# Altium project PDB_Motherboard_Layout_27.PrjPcb
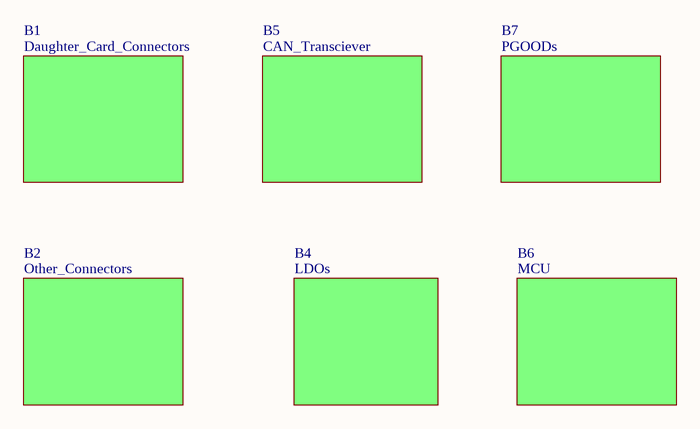
[diagram p0: Motherboard.SchDoc]
7 sheets, 128 parts. Net scope: flat (ports and power ports of the same name join across sheets).
Board file: testPCB.PcbDoc
Sheets:
  Motherboard.SchDoc
    B1 = Daughter_Card_Connectors.SchDoc
    B2 = Other_Connectors.SchDoc
    B4 = LDOs.SchDoc
    B5 = CAN_Transciever.SchDoc
    B6 = MCU.SchDoc
    B7 = PGOODs.SchDoc

## Sheet Motherboard.SchDoc
size A; SheetNumber: 1; SheetTotal: 7

### Sub-sheets
B1 = Daughter_Card_Connectors: no entries
B2 = Other_Connectors: no entries
B4 = LDOs: no entries
B5 = CAN_Transciever: no entries
B6 = MCU: no entries
B7 = PGOODs: no entries

## Sheet Daughter_Card_Connectors.SchDoc
size A; SheetNumber: 7; SheetTotal: 7
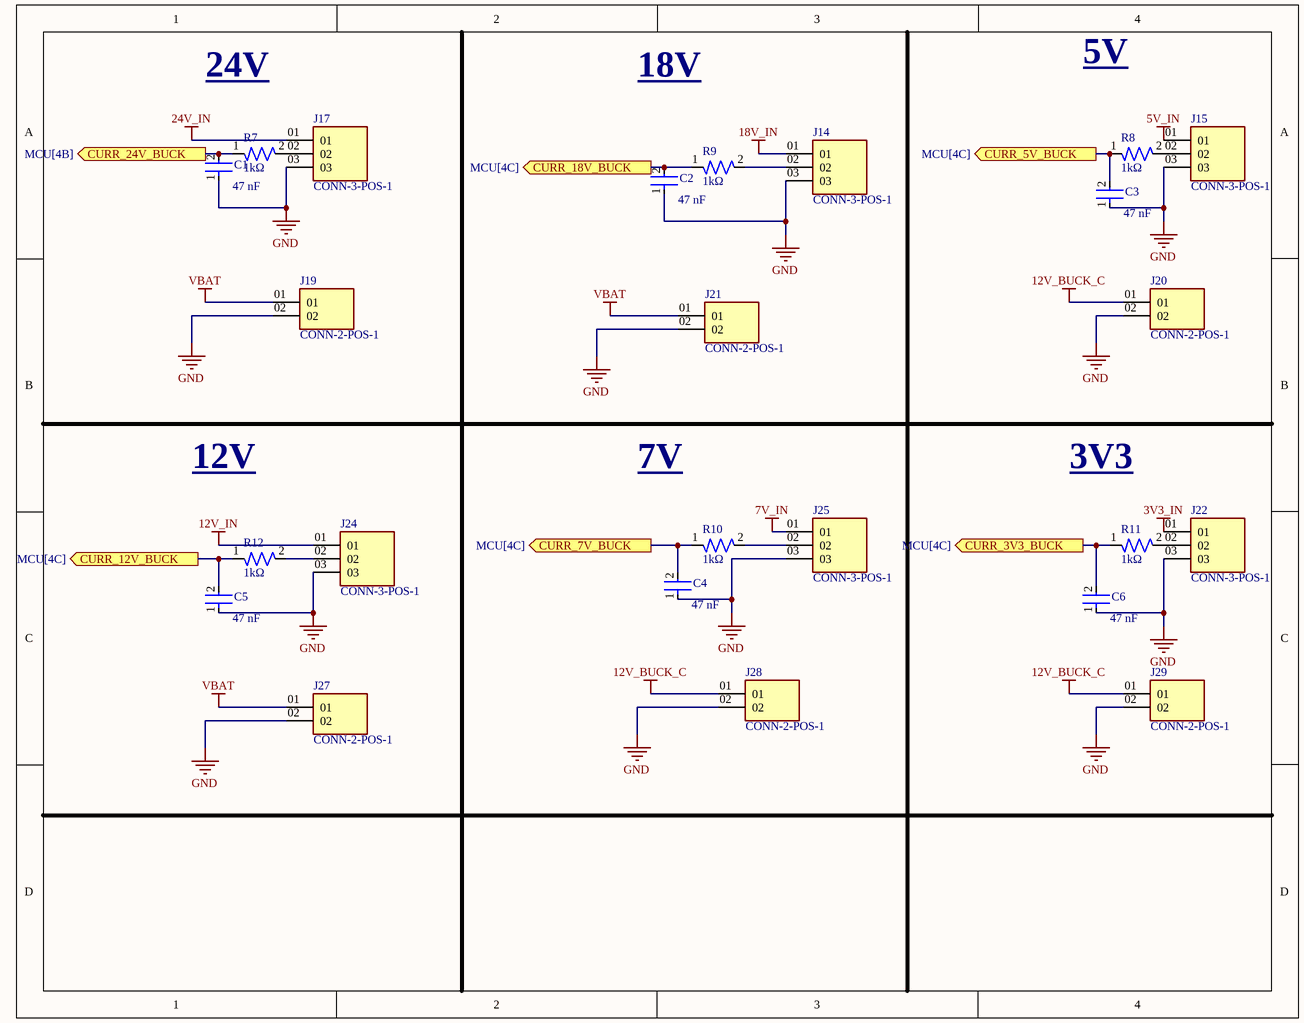
[diagram p1: Daughter_Card_Connectors.SchDoc]

### Parts
C1  Capacitance: 47 nF  [CAP-0603]  (hidden comment: GRM1885C1H302JA01D)
C2  Capacitance: 47 nF  [CAP-0603]  (hidden comment: GRM1885C1H302JA01D)
C3  Capacitance: 47 nF  [CAP-0603]  (hidden comment: GRM1885C1H302JA01D)
C4  Capacitance: 47 nF  [CAP-0603]  (hidden comment: GRM1885C1H302JA01D)
C5  Capacitance: 47 nF  [CAP-0603]  (hidden comment: GRM1885C1H302JA01D)
C6  Capacitance: 47 nF  [CAP-0603]  (hidden comment: GRM1885C1H302JA01D)
J14  CONN-3-POS-1  [SAMTEC_UMPS-03-03.5-L-V-S-W-TR]
J15  CONN-3-POS-1  [SAMTEC_UMPS-03-03.5-L-V-S-W-TR]
J17  CONN-3-POS-1  [SAMTEC_UMPS-03-03.5-L-V-S-W-TR]
J19  CONN-2-POS-1  [SAMTEC_UMPS-02-X-X-V-S-W-X]
J20  CONN-2-POS-1  [SAMTEC_UMPS-02-X-X-V-S-W-X]
J21  CONN-2-POS-1  [SAMTEC_UMPS-02-X-X-V-S-W-X]
J22  CONN-3-POS-1  [SAMTEC_UMPS-03-03.5-L-V-S-W-TR]
J24  CONN-3-POS-1  [SAMTEC_UMPS-03-03.5-L-V-S-W-TR]
J25  CONN-3-POS-1  [SAMTEC_UMPS-03-03.5-L-V-S-W-TR]
J27  CONN-2-POS-1  [SAMTEC_UMPS-02-X-X-V-S-W-X]
J28  CONN-2-POS-1  [SAMTEC_UMPS-02-X-X-V-S-W-X]
J29  CONN-2-POS-1  [SAMTEC_UMPS-02-X-X-V-S-W-X]
R7  Resistance: 1kΩ  [RES-0603]  (hidden comment: CRF2010-J/-000ELF)
R8  Resistance: 1kΩ  [RES-0603]  (hidden comment: CRF2010-J/-000ELF)
R9  Resistance: 1kΩ  [RES-0603]  (hidden comment: CRF2010-J/-000ELF)
R10  Resistance: 1kΩ  [RES-0603]  (hidden comment: CRF2010-J/-000ELF)
R11  Resistance: 1kΩ  [RES-0603]  (hidden comment: CRF2010-J/-000ELF)
R12  Resistance: 1kΩ  [RES-0603]  (hidden comment: CRF2010-J/-000ELF)

### Ports
CURR_3V3_BUCK (out, see MCU[4C]), CURR_5V_BUCK (out, see MCU[4C]), CURR_7V_BUCK (out, see MCU[4C]), CURR_12V_BUCK (out, see MCU[4C]), CURR_18V_BUCK (out, see MCU[4C]), CURR_24V_BUCK (out, see MCU[4B])

### Nets
3V3_IN: J22.01
5V_IN: J15.01
7V_IN: J25.01
12V_BUCK_C: J20.01 J28.01 J29.01
12V_IN: J24.01
18V_IN: J14.01
24V_IN: J17.01
GND: C1.1 C2.1 C3.1 C4.1 C5.1 C6.1 J14.03 J15.03 J17.03 J19.02 J20.02 J21.02 J22.03 J24.03 J25.03 J27.02 J28.02 J29.02  [project net AGND]
VBAT: J19.01 J21.01 J27.01
CURR_3V3_BUCK: C6.2 R11.1 ; port CURR_3V3_BUCK
CURR_5V_BUCK: C3.2 R8.1 ; port CURR_5V_BUCK
CURR_7V_BUCK: C4.2 R10.1 ; port CURR_7V_BUCK
CURR_12V_BUCK: C5.2 R12.1 ; port CURR_12V_BUCK
CURR_18V_BUCK: C2.2 R9.1 ; port CURR_18V_BUCK
CURR_24V_BUCK: C1.2 R7.1 ; port CURR_24V_BUCK
NetJ14_02: J14.02 R9.2
NetJ15_02: J15.02 R8.2
NetJ17_02: J17.02 R7.2
NetJ22_02: J22.02 R11.2
NetJ24_02: J24.02 R12.2
NetJ25_02: J25.02 R10.2

### Notes on the sheet
- 24V
- 18V
- 5V
- 12V
- 7V
- 3V3

### Library data of the parts
C1-C6 = CAP-3N-0001: 3000 pF ±5% 50V Ceramic Capacitor C0G, NP0 0603 (1608 Metric); Device Class: Ceramic; Size: 1210; ComponentLink1Description: Datasheet; ComponentLink1URL: https://mm.digikey.com/Volume0/opasdata/d220001/medias/docus/41/CL32B106KBJNNNE_Spec.pdf; Voltage: 50V
J14 J15 J17 J22 J24 J25 = CONN-3-POS-1: 3 Position Receptacle, Female Blade Sockets Connector Solder 0.079 (2.00mm) Surface Mount; MF: Samtec Inc.; MP: UMPS-03-03.5-L-V-S-W-TR; SnapEDA_Link: https://www.snapeda.com/parts/UMPS-03-03.5-L-V-S-W-TR/Samtec/view-part/?ref=snap; Package: None; Value: *; Check_prices: https://www.snapeda.com/parts/UMPS-03-03.5-L-V-S-W-TR/Samtec/view-part/?ref=eda
J19-J21 J27-J29 = CONN-2-POS-1: MF: SAMTEC; MP: UMPS-02-X-X-V-S-W-X; Package: None; Price: None; Value: *; Availability: Unavailable
R7-R12 = RES-0-0001: 0 Ohms Jumper Chip Resistor 2010 (5025 Metric) Automotive AEC-Q200 Metal Element; Tolerance: 1%; Size: 0603; ComponentLink1Description: Datasheet; ComponentLink1URL: https://www.yageo.com/upload/media/product/products/datasheet/rchip/PYu-RC_Group_51_RoHS_L_12.pdf

## Sheet Other_Connectors.SchDoc
size A; SheetNumber: 6; SheetTotal: 7
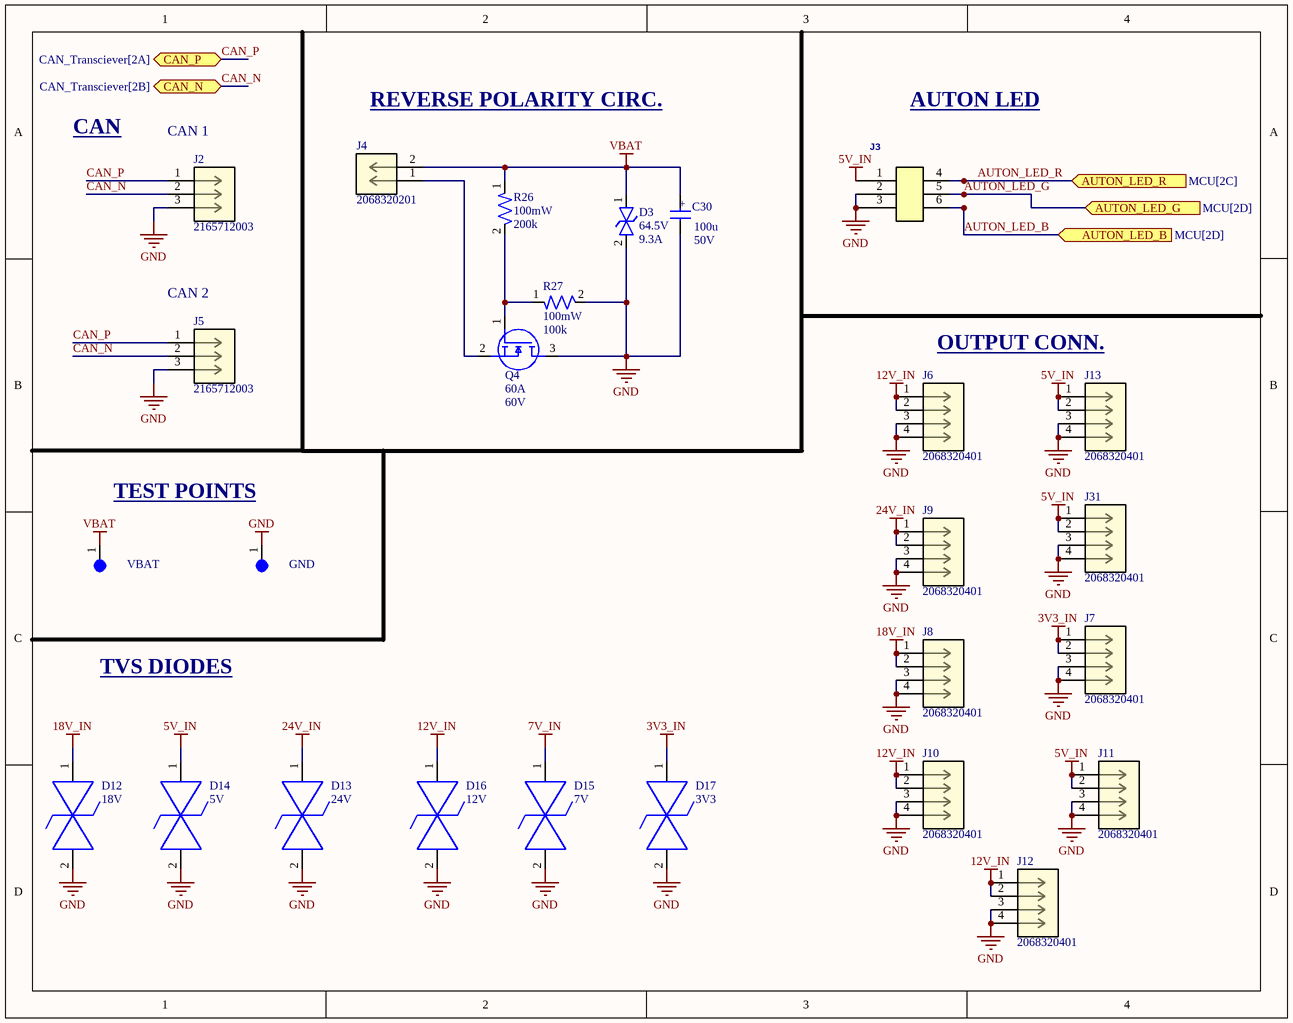
[diagram p2: Other_Connectors.SchDoc]

### Parts
C30  Capacitance: 100u  Voltage: 50V  [WCAP-ATUL_8X11.5(DXL)]  (hidden comment: 860040674004)
D3  Voltage Rating: 64.5V  Current Rating: 9.3A  [DO-214AA (SMBJ)]  (hidden comment: SMBJ40CA)
D12  Clamping Voltage: 18V  [DO-214AA (SMBJ)]  (hidden comment: SMBJ18)
D13  Voltage: 24V  [DO-214AA (SMBJ)]  (hidden comment: SMBJ5.0)
D14  Voltage: 5V  [DO-214AA (SMBJ)]  (hidden comment: SMBJ5.0)
D15  Voltage: 7V  [DO-214AA (SMBJ)]  (hidden comment: SMBJ12)
D16  Voltage: 12V  [DO-214AA (SMBJ)]  (hidden comment: SMBJ12)
D17  Voltage: 3V3  [DO-214AA (SMBJ)]  (hidden comment: SMBJ12)
GND  5003  [TEST-POINT-0001]  (value not drawn)
J2  2165712003  [CONN_2165710003-SD_03_MOL]
J3  Molex 43045-0612  [CONN_2068320000-SD_06_MOL]  (value not drawn)
J4  2068320201  [CONN_2068320000-SD_02_MOL]
J5  2165712003  [CONN_2165710003-SD_03_MOL]
J6  2068320401  [CONN_2068320000-SD_04_MOL]
J7  2068320401  [CONN_2068320000-SD_04_MOL]
J8  2068320401  [CONN_2068320000-SD_04_MOL]
J9  2068320401  [CONN_2068320000-SD_04_MOL]
J10  2068320401  [CONN_2068320000-SD_04_MOL]
J11  2068320401  [CONN_2068320000-SD_04_MOL]
J12  2068320401  [CONN_2068320000-SD_04_MOL]
J13  2068320401  [CONN_2068320000-SD_04_MOL]
J31  2068320401  [CONN_2068320000-SD_04_MOL]
Q4  Voltage: 60V  Continuous Current: 60A  [IC-8VSONCLIP]  (hidden comment: CSD18543Q3AT)
R26  Power: 100mW  Resistance: 200k  [RES-0603]  (hidden comment: RC0603FR-07200KL)
R27  Power: 100mW  Resistance: 100k  [RES-0603]  (hidden comment: RC0603FR-07100KL)
VBAT  5003  [TEST-POINT-0001]  (value not drawn)

### Ports
AUTON_LED_B (in, see MCU[2D]), AUTON_LED_G (in, see MCU[2D]), AUTON_LED_R (in, see MCU[2C]), CAN_N (bidir, see CAN_Transciever[2B]), CAN_P (bidir, see CAN_Transciever[2A])

### Nets
3V3_IN: D17.1 J7.1 J7.2
5V_IN: D14.1 J3.1 J11.1 J11.2 J13.1 J13.2 J31.1 J31.2
7V_IN: D15.1
12V_IN: D16.1 J6.1 J6.2 J10.1 J10.2 J12.1 J12.2
18V_IN: D12.1 J8.1 J8.2
24V_IN: D13.1 J9.1 J9.2
GND: C30.2(NEG) D3.2 D12.2 D13.2 D14.2 D15.2 D16.2 D17.2 GND.1 J2.3 J3.2 J3.3 J5.3 J6.3 J6.4 J7.3 J7.4 J8.3 J8.4 J9.3 J9.4 J10.3 J10.4 J11.3 J11.4 J12.3 J12.4 J13.3 J13.4 J31.3 J31.4 Q4.3(D) R27.2  [project net AGND]
VBAT: C30.1(POS) D3.1 J4.2 R26.1 VBAT.1
AUTON_LED_B: J3.6 ; port AUTON_LED_B
AUTON_LED_G: J3.5 ; port AUTON_LED_G
AUTON_LED_R: J3.4 ; port AUTON_LED_R
CAN_N: J2.2 J5.2 ; port CAN_N
CAN_P: J2.1 J5.1 ; port CAN_P
NetJ4_1: J4.1 Q4.2(S)
NetQ4_1: Q4.1(G) R26.2 R27.1

### Notes on the sheet
- CAN
- (near J2) CAN 1
- REVERSE POLARITY CIRC.
- AUTON LED
- (near J5) CAN 2
- OUTPUT CONN.
- TEST POINTS
- TVS DIODES
- (in symbol CAP-100U-0002) +

### Library data of the parts
C30 = CAP-100U-0002: 100 µF 50 V Aluminum Electrolytic Capacitors Radial, Can 7000 Hrs @ 105°C
D3 = DIO-TVS-0001: TVS DIODE 40VWM 64.5VC DO214AA; ComponentLink1Description: Datasheet; ComponentLink1URL: https://www.littelfuse.com/media?resourcetype=datasheets&itemid=09a6ae9a-73cb-4ac4-acac-e6dab92ab953&filename=littelfuse_tvs_diode_smbj_datasheet.pdf
D12 = DIODE-18V-0001: 30.66V Clamp 20.6A Ipp Tvs Diode Surface Mount DO-214AA (SMBJ); Manufacturer_Name: Littelfuse Inc; Copyright: Copyright (C) 2025 Ultra Librarian. All rights reserved.; Manufacturer_Part_Number: SMBJ18
D13 D14 = DIO-TVS-5V: 9.66V Clamp 65.3A Ipp Tvs Diode Surface Mount DO-214AA (SMBJ)
D15-D17 = DIO-TVS-12V: 20.9V Clamp 30.2A Ipp Tvs Diode Surface Mount DO-214AA (SMBJ)
GND VBAT = TEST-POINT-0001: Oranange PC Test Point, Miniature Phoisphor Bronze Silver Plating Through Hole Mounting Type
J2 J5 = CONN-3-POS-2: Micro-Fit+ Vertical Header, Through Hole, 3.00mm Pitch, Single Row, 3 Circuits, 0.38Âµm Gold (Au) Plating, Glow-Wire Capable, Black; Manufacturer_Name: Molex Connector Corporation; Copyright: Copyright (C) 2026 Ultra Librarian. All rights reserved.; Manufacturer_Part_Number: 2165712003; RefDes: RefDes; Type: Type
J3 = CONN-6POS-0001: CONN HEADER VERT 6POS 3MM; ComponentLink1Description: Datasheet; ComponentLink1URL: https://tools.molex.com/pdm_docs/ps/PS-43045.pdf
J4 = CONN-2-POS-2: Micro-Fit+ Vertical Header, Through Hole, 3.00mm Pitch, Dual Row, 2 Circuits, Tin (Sn) Plating, Glow-Wire Capable, Black, Tray; Manufacturer_Name: Molex Connector Corporation; Copyright: Copyright (C) 2025 Ultra Librarian. All rights reserved.; Manufacturer_Part_Number: 2068320201; RefDes: RefDes; Type: Type
J6-J13 J31 = CONN-4-POS-1: Micro-Fit+ Vertical Header, Through Hole, 3.00mm Pitch, Dual Row, 4 Circuits, Tin (Sn) Plating, Glow-Wire Capable, Black, Tray; Manufacturer_Name: Molex Connector Corporation; Copyright: Copyright (C) 2025 Ultra Librarian. All rights reserved.; Manufacturer_Part_Number: 2068320401; RefDes: RefDes; Type: Type
Q4 = NMOS-60A-0001: MOSFET N-CH 60V 12A/60A 8VSON; ComponentLink2Description: Datasheet; ComponentLink2URL: http://www.ti.com/lit/ds/symlink/csd18543q3a.pdf
R26 = RES-200k-0001: RES SMD 200K OHM 1% 1/10W 0603; Tolerance: 1%; Size: 0603; ComponentLink1Description: Datasheet; ComponentLink1URL: https://www.yageo.com/upload/media/product/products/datasheet/rchip/PYu-RC_Group_51_RoHS_L_12.pdf
R27 = RES-100k-0001: RES SMD 100K OHM 1% 1/10W 0603; Tolerance: 1%; Size: 0603; ComponentLink1Description: Datasheet; ComponentLink1URL: https://www.yageo.com/upload/media/product/products/datasheet/rchip/PYu-RC_Group_51_RoHS_L_12.pdf

## Sheet LDOs.SchDoc
size A; SheetNumber: 5; SheetTotal: 7
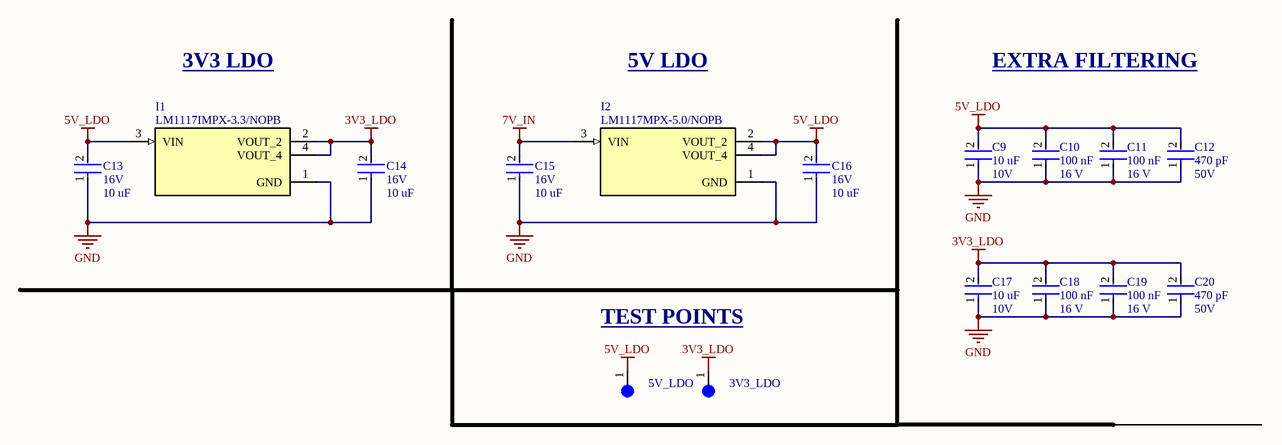
[diagram p3: LDOs.SchDoc]

### Parts
3V3_LDO  5003  [TEST-POINT-0001]  (value not drawn)
5V_LDO  5003  [TEST-POINT-0001]  (value not drawn)
C9  Voltage: 10V  Capacitance: 10 uF  [CAP-0603]  (hidden comment: CC0603KRX5R6BB106)
C10  Voltage Rating: 16 V  Capacitance: 100 nF  [CAP-0603]  (hidden comment: CC0402KRX7R7BB104)
C11  Voltage Rating: 16 V  Capacitance: 100 nF  [CAP-0603]  (hidden comment: CC0402KRX7R7BB104)
C12  Voltage: 50V  Capacitance: 470 pF  [CAP-0805]  (hidden comment: CC0805JRNPO9BN471)
C13  Voltage: 16V  Capacitance: 10 uF  [CAP-1206]  (hidden comment: 293D106X9016A2TE3)
C14  Voltage: 16V  Capacitance: 10 uF  [CAP-1206]  (hidden comment: 293D106X9016A2TE3)
C15  Voltage: 16V  Capacitance: 10 uF  [CAP-1206]  (hidden comment: 293D106X9016A2TE3)
C16  Voltage: 16V  Capacitance: 10 uF  [CAP-1206]  (hidden comment: 293D106X9016A2TE3)
C17  Voltage: 10V  Capacitance: 10 uF  [CAP-0603]  (hidden comment: CC0603KRX5R6BB106)
C18  Voltage Rating: 16 V  Capacitance: 100 nF  [CAP-0603]  (hidden comment: CC0402KRX7R7BB104)
C19  Voltage Rating: 16 V  Capacitance: 100 nF  [CAP-0603]  (hidden comment: CC0402KRX7R7BB104)
C20  Voltage: 50V  Capacitance: 470 pF  [CAP-0805]  (hidden comment: CC0805JRNPO9BN471)
I1  LM1117IMPX-3.3/NOPB  [IC-SOT-223-4]
I2  LM1117MPX-5.0/NOPB  [IC-SOT-223-4]

### Nets
3V3_LDO: 3V3_LDO.1 C14.2 C17.2 C18.2 C19.2 C20.2 I1.2(VOUT_2) I1.4(VOUT_4)  [project net VBAT_MCU]
5V_LDO: 5V_LDO.1 C9.2 C10.2 C11.2 C12.2 C13.2 C16.2 I1.3(VIN) I2.2(VOUT_2) I2.4(VOUT_4)
7V_IN: C15.2 I2.3(VIN)
GND: C9.1 C10.1 C11.1 C12.1 C13.1 C14.1 C15.1 C16.1 C17.1 C18.1 C19.1 C20.1 I1.1(GND) I2.1(GND)  [project net AGND]

### Notes on the sheet
- 3V3 LDO
- 5V LDO
- EXTRA FILTERING
- TEST POINTS

### Library data of the parts
3V3_LDO 5V_LDO = TEST-POINT-0001: as GND on sheet Other_Connectors
C9 C17 = CAP-10U-0001: CAP CER 10UF 10V X5R 0603; ComponentLink1Description: Datasheet; ComponentLink1URL: https://www.yageo.com/upload/media/product/app/datasheet/mlcc/upy-gphc_x5r_4v-to-50v.pdf; Device Class: Ceramic; Size: 0603
C10 C11 C18 C19 = CAP-0.1U-0001: CAP CER 0.1UF 16V X7R 0402; ComponentLink2Description: Datasheet; ComponentLink2URL: https://www.yageo.com/upload/media/product/productsearch/datasheet/mlcc/UPY-GPHC_X7R_6.3V-to-250V_24.pdf; Device Class: Ceramic; Size: 0402
C12 C20 = CAP-470P-0001: CAP CER 470PF 50V C0G/NPO 0805; Device Class: Ceramic; Size: 0805; ComponentLink1Description: Datasheet; ComponentLink1URL: https://www.yageo.com/upload/media/product/productsearch/datasheet/mlcc/UPY-GP_NP0_16V-to-50V_18.pdf
C13-C16 = CAP-10U-0004: CAP TANT 10UF 10% 16V 1206; Device Class: Tantalum; Size: 1206; ComponentLink1Description: Datasheet; ComponentLink1URL: https://www.lcsc.com/datasheet/lcsc_datasheet_2304140030_Vishay-Intertech-293D106X9016A2TE3_C110038.pdf
I1 = IC_LDO_3V3_0001: IC REG LIN 3.3V 800MA SOT223-4; ComponentLink1Description: New link; ComponentLink1URL: https://www.ti.com/lit/ds/symlink/lm1117.pdf?HQS=dis-dk-null-digikeymode-dsf-pf-null-wwe&ts=1721700739746
I2 = IC_LDO_5V_0001: IC REG LINEAR 5V 800MA SOT223-4; ComponentLink1Description: Datasheet; ComponentLink1URL: https://www.ti.com/lit/ds/symlink/lm1117.pdf?HQS=dis-dk-null-digikeymode-dsf-pf-null-wwe&ts=1721700739746

## Sheet CAN_Transciever.SchDoc
size A; SheetNumber: 2; SheetTotal: 7
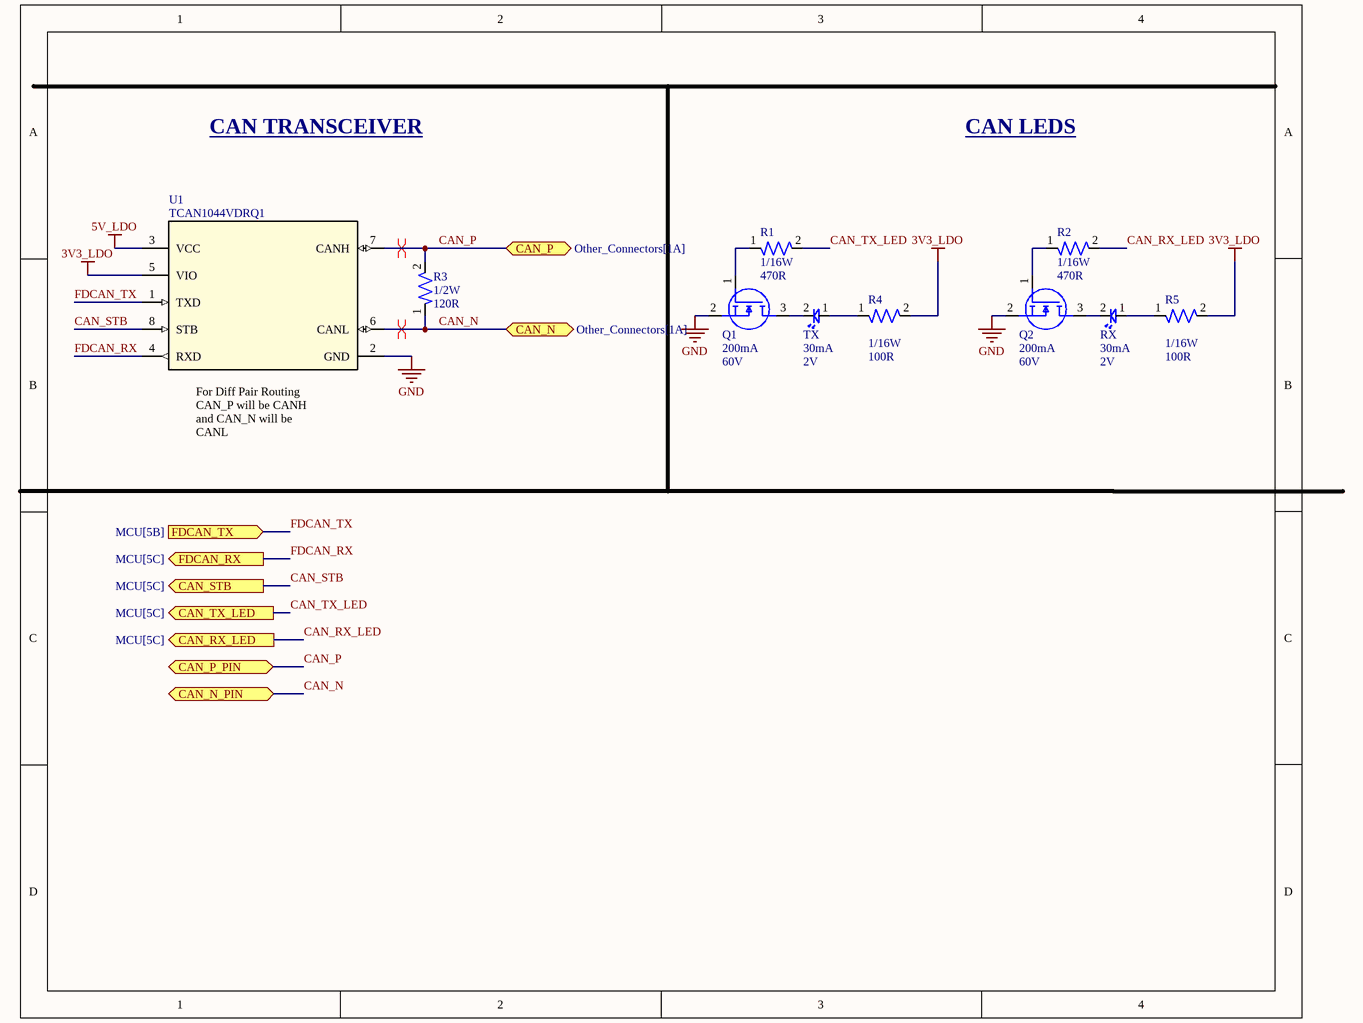
[diagram p4: CAN_Transciever.SchDoc]

### Parts
Q1  Continuous Current: 200mA  Voltage: 60V  [IC-SOT23-3]  (hidden comment: T2N7002AK,LM)
Q2  Continuous Current: 200mA  Voltage: 60V  [IC-SOT23-3]  (hidden comment: T2N7002AK,LM)
R1  Power: 1/16W  Resistance: 470R  [RES-0603]  (hidden comment: RC0402FR-07470RL)
R2  Power: 1/16W  Resistance: 470R  [RES-0603]  (hidden comment: RC0402FR-07470RL)
R3  Power: 1/2W  Resistance: 120R  [RES-1210]  (hidden comment: RC1210FR-07120RL)
R4  Power: 1/16W  Resistance: 100R  [RES-0603]  (hidden comment: RC0603FR-07100RL)
R5  Power: 1/16W  Resistance: 100R  [RES-0603]  (hidden comment: RC0603FR-07100RL)
RX  Forward Current: 30mA  Forward Voltage: 2V  [LED-0603]  (hidden comment: BL-HKC36G-AV-TRB)
TX  Forward Current: 30mA  Forward Voltage: 2V  [LED-0603]  (hidden comment: BL-HKC36G-AV-TRB)
U1  TCAN1044VDRQ1  [IC-8SOIC]

### Ports
CAN_N (bidir, see Other_Connectors[1A]), CAN_N_PIN (bidir), CAN_P (bidir, see Other_Connectors[1A]), CAN_P_PIN (bidir), CAN_RX_LED (out, see MCU[5C]), CAN_STB (out, see MCU[5C]), CAN_TX_LED (out, see MCU[5C]), FDCAN_RX (out, see MCU[5C]), FDCAN_TX (in, see MCU[5B])

### Nets
3V3_LDO: R4.2 R5.2 U1.5(VIO)  [project net VBAT_MCU]
5V_LDO: U1.3(VCC)
GND: Q1.2(S) Q2.2(S) U1.2(GND)  [project net AGND]
CAN_N: R3.1 U1.6(CANL) ; port CAN_N_PIN, port CAN_N
CAN_P: R3.2 U1.7(CANH) ; port CAN_P_PIN, port CAN_P
CAN_RX_LED: R2.2 ; port CAN_RX_LED
CAN_STB: U1.8(STB) ; port CAN_STB
CAN_TX_LED: R1.2 ; port CAN_TX_LED
FDCAN_RX: U1.4(RXD) ; port FDCAN_RX
FDCAN_TX: U1.1(TXD) ; port FDCAN_TX
NetQ1_1: Q1.1(G) R1.1
NetQ1_3: Q1.3(D) TX.2
NetQ2_1: Q2.1(G) R2.1
NetQ2_3: Q2.3(D) RX.2
NetR4_1: R4.1 TX.1
NetR5_1: R5.1 RX.1

### Layout directives
differential pair: CAN_N, CAN_P

### Notes on the sheet
- CAN TRANSCEIVER
- CAN LEDS
- (near U1) For Diff Pair Routing CAN_P will be CANH and CAN_N will be CANL

### Library data of the parts
Q1 Q2 = NMOS-200MA-0001: MOSFET N-CH 60V 200MA SOT23; ComponentLink1Description: Datasheet; ComponentLink1URL: https://toshiba.semicon-storage.com/info/T2N7002AK_datasheet_en_20150401.pdf?did=29712&prodName=T2N7002AK
R1 R2 = RES-470-0001: RES 470 OHM 1% 1/16W 0603; Tolerance: 1%; ComponentLink1Description: Datasheet; ComponentLink1URL: https://www.yageo.com/upload/media/product/products/datasheet/rchip/PYu-RC_Group_51_RoHS_L_12.pdf; Size: 0603
R3 = RES-120-0001: RES 120 OHM 1% 1/2W 1210; Tolerance: 1%; Size: 1210; ComponentLink1Description: Datasheet; ComponentLink1URL: https://www.yageo.com/upload/media/product/products/datasheet/rchip/PYu-RC_Group_51_RoHS_L_12.pdf
R4 R5 = RES-100-0001: RES 100 OHM 1% 1/16W 0603; Tolerance: 1%; ComponentLink1Description: Datasheet; ComponentLink1URL: https://www.yageo.com/upload/media/product/products/datasheet/rchip/PYu-RC_Group_51_RoHS_L_12.pdf; Size: 0603
RX TX = LED-0001: LED YELLOW CLEAR 0603 SMD; ComponentLink1Description: Datasheet; ComponentLink1URL: https://www.americanbrightled.com/pdffiles/led-components/smt/BL-HKC36G-AV-TRB.pdf
U1 = IC-CAN-0001: IC TRANSCEIVER 1/1 8SOIC; ComponentLink1Description: Datasheet; ComponentLink1URL: https://www.ti.com/lit/ds/symlink/tcan1044-q1.pdf?HQS=dis-dk-null-digikeymode-dsf-pf-null-wwe&ts=1728758303289&ref_url=https%253A%252F%252Fwww.ti.com%252Fgeneral%252Fdocs%252Fsuppproductinfo.tsp%253FdistId%253D10%2526gotoUrl%253Dhttps%253A%252F%252Fwww.ti.com%252Flit%252Fgpn%252Ftcan1044-q1

## Sheet MCU.SchDoc
size 381 x 241 mm; SheetNumber: 3; SheetTotal: 7
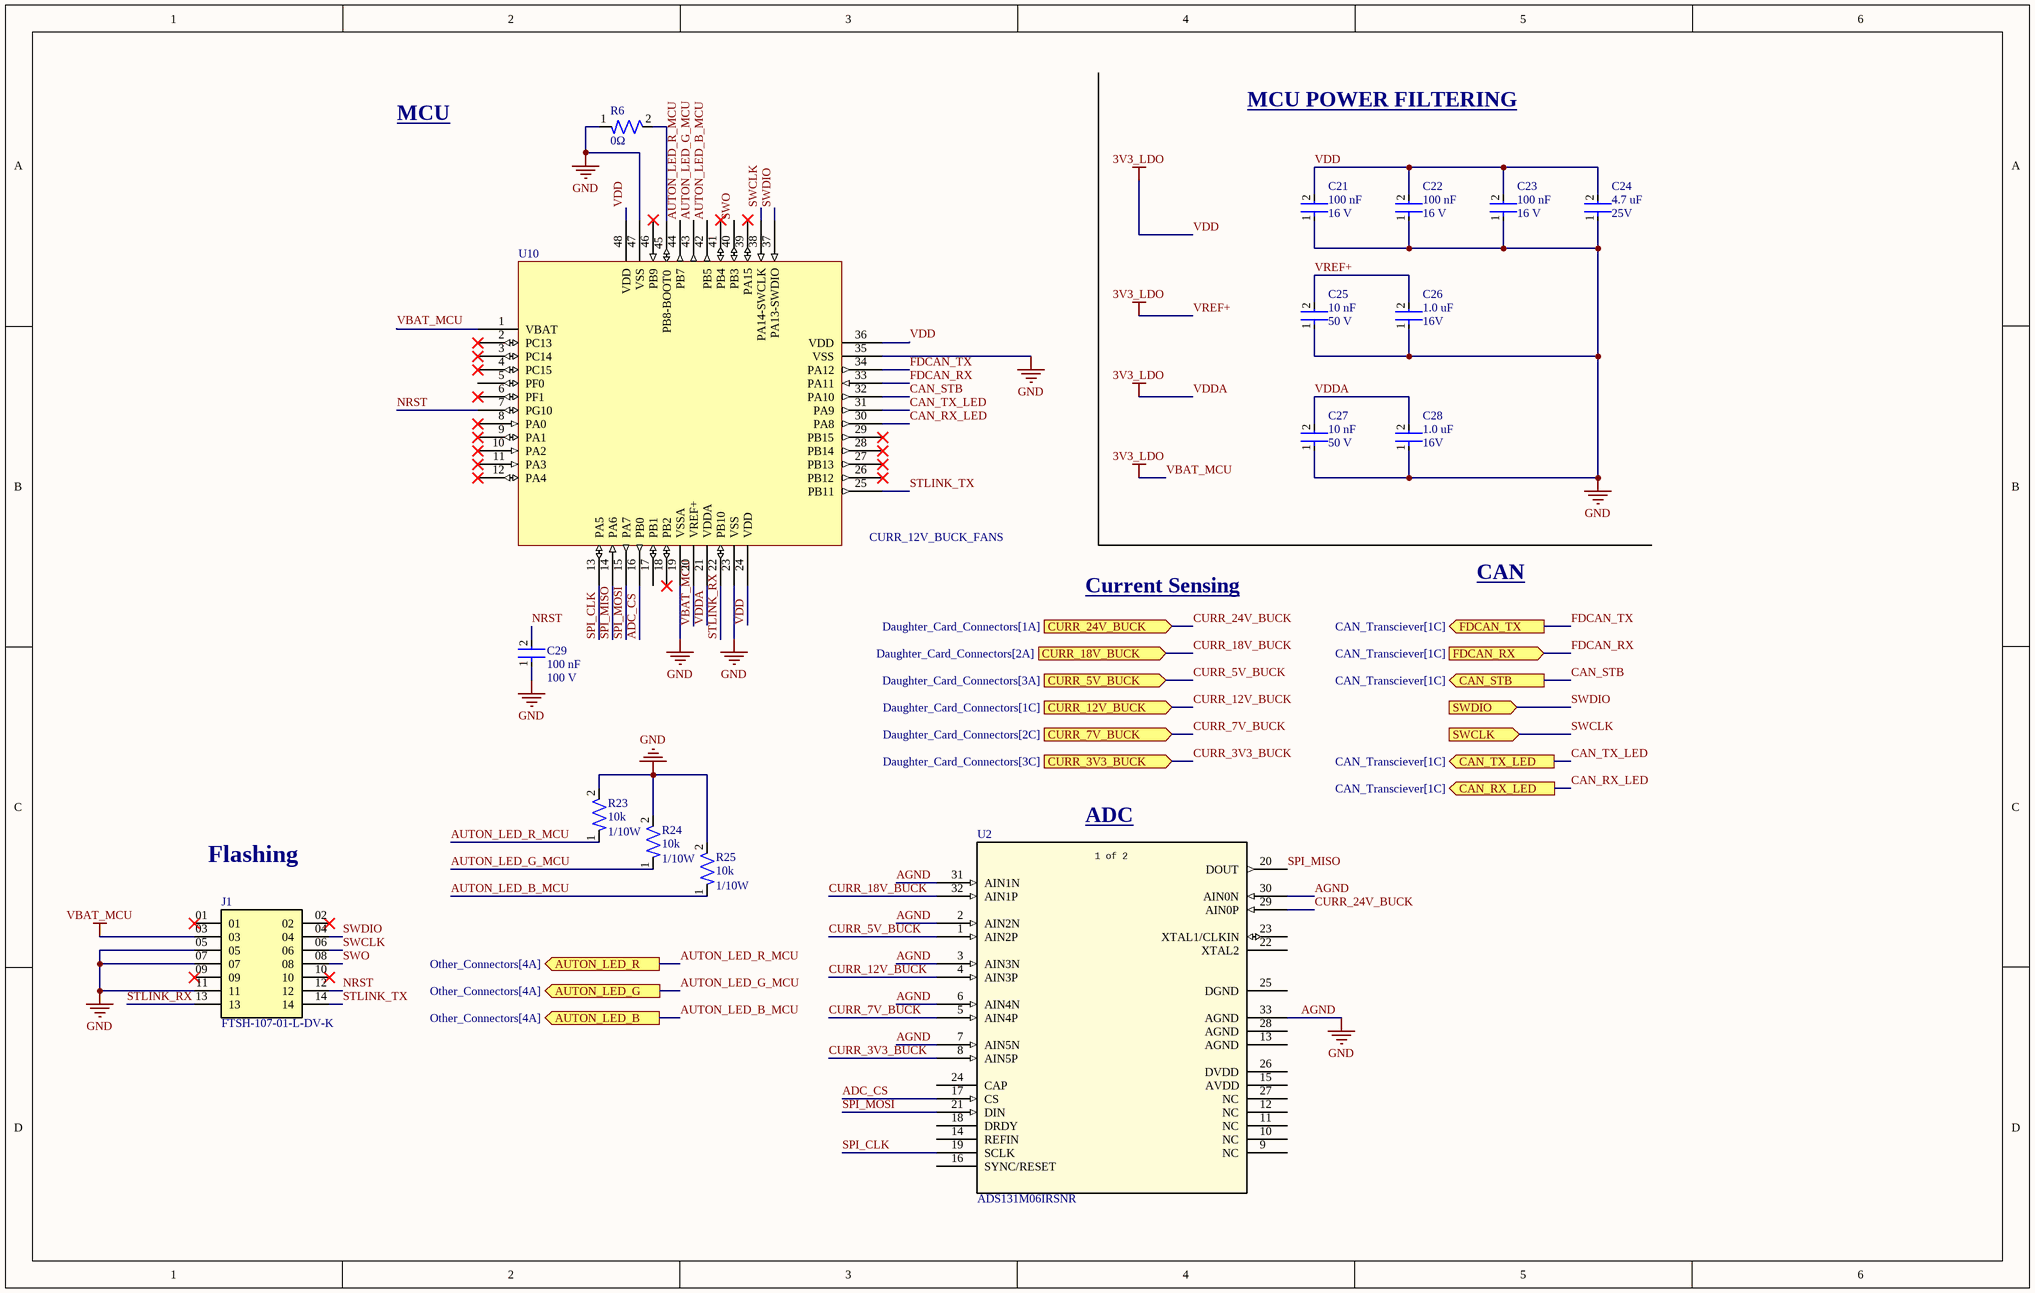
[diagram p5: MCU.SchDoc]

### Parts
C21  Capacitance: 100 nF  Voltage Rating: 16 V  [CAP-0603]  (hidden comment: CC0603KRX7R7BB104)
C22  Capacitance: 100 nF  Voltage Rating: 16 V  [CAP-0603]  (hidden comment: CC0603KRX7R7BB104)
C23  Capacitance: 100 nF  Voltage Rating: 16 V  [CAP-0603]  (hidden comment: CC0603KRX7R7BB104)
C24  Capacitance: 4.7 uF  Voltage: 25V  [CAP-0603]  (hidden comment: CC0603KRX5R8BB475)
C25  Voltage: 50 V  Capacitance: 10 nF  [CAP-0603]  (hidden comment: CC0603KPX7R9BB103)
C26  Capacitance: 1.0 uF  Voltage: 16V  [CAP-0603]  (hidden comment: CC0603KRX7R7BB105)
C27  Voltage: 50 V  Capacitance: 10 nF  [CAP-0603]  (hidden comment: CC0603KPX7R9BB103)
C28  Capacitance: 1.0 uF  Voltage: 16V  [CAP-0603]  (hidden comment: CC0603KRX7R7BB105)
C29  Capacitance: 100 nF  Voltage: 100 V  [CAP-0603]  (hidden comment: CC0603KRX7R0BB104)
J1  FTSH-107-01-L-DV-K  [SAMTEC_FTSH-107-01-L-DV-K]
R6  Resistance: 0Ω  [RES-0603]  (hidden comment: CRF2010-J/-000ELF)
R23  Resistance: 10k  Power: 1/10W  [RES-0603]  (hidden comment: RC0603JR-0710KL)
R24  Resistance: 10k  Power: 1/10W  [RES-0603]  (hidden comment: RC0603JR-0710KL)
R25  Resistance: 10k  Power: 1/10W  [RES-0603]  (hidden comment: RC0603JR-0710KL)
U2  ADS131M06IRSNR  [QFN_M06IRSNR_TEX]
U10  STM32G431CBT6  [IC-LQFP48]  (value not drawn)

### Ports
AUTON_LED_B (out, see Other_Connectors[4A]), AUTON_LED_G (out, see Other_Connectors[4A]), AUTON_LED_R (out, see Other_Connectors[4A]), CAN_RX_LED (out, see CAN_Transciever[1C]), CAN_STB (out, see CAN_Transciever[1C]), CAN_TX_LED (out, see CAN_Transciever[1C]), CURR_3V3_BUCK (in, see Daughter_Card_Connectors[3C]), CURR_5V_BUCK (in, see Daughter_Card_Connectors[3A]), CURR_7V_BUCK (in, see Daughter_Card_Connectors[2C]), CURR_12V_BUCK (in, see Daughter_Card_Connectors[1C]), CURR_18V_BUCK (in, see Daughter_Card_Connectors[2A]), CURR_24V_BUCK (in, see Daughter_Card_Connectors[1A]), FDCAN_RX (in, see CAN_Transciever[1C]), FDCAN_TX (out, see CAN_Transciever[1C]), SWCLK (in), SWDIO (in)

### Nets
AGND: C21.1 C22.1 C23.1 C24.1 C25.1 C26.1 C27.1 C28.1 C29.1 J1.05 J1.07 J1.11 R6.1 R23.2 R24.2 R25.2 U2.2(AIN2N) U2.3(AIN3N) U2.6(AIN4N) U2.7(AIN5N) U2.30(AIN0N) U2.31(AIN1N) U2.33(AGND) U10.19(VSSA) U10.23(VSS) U10.35(VSS) U10.47(VSS)  [also labelled GND]
VBAT_MCU: C21.2 C22.2 C23.2 C24.2 C25.2 C26.2 C27.2 C28.2 J1.03 U10.1(VBAT) U10.20(VREF+) U10.21(VDDA) U10.24(VDD) U10.36(VDD) U10.48(VDD)  [also labelled 3V3_LDO, VDD, VDDA, VREF+]
ADC_CS: U2.17(CS) U10.16(PB0)
AUTON_LED_B_MCU: R25.1 U10.42(PB5) ; port AUTON_LED_B  [project net AUTON_LED_B]
AUTON_LED_G_MCU: R24.1 U10.43(PB6) ; port AUTON_LED_G  [project net AUTON_LED_G]
AUTON_LED_R_MCU: R23.1 U10.44(PB7) ; port AUTON_LED_R  [project net AUTON_LED_R]
CAN_RX_LED: U10.30(PA8) ; port CAN_RX_LED
CAN_STB: U10.32(PA10) ; port CAN_STB
CAN_TX_LED: U10.31(PA9) ; port CAN_TX_LED
CURR_3V3_BUCK: U2.8(AIN5P) ; port CURR_3V3_BUCK
CURR_5V_BUCK: U2.1(AIN2P) ; port CURR_5V_BUCK
CURR_7V_BUCK: U2.5(AIN4P) ; port CURR_7V_BUCK
CURR_12V_BUCK: U2.4(AIN3P) ; port CURR_12V_BUCK
CURR_18V_BUCK: U2.32(AIN1P) ; port CURR_18V_BUCK
CURR_24V_BUCK: U2.29(AIN0P) ; port CURR_24V_BUCK
FDCAN_RX: U10.33(PA11) ; port FDCAN_RX
FDCAN_TX: U10.34(PA12) ; port FDCAN_TX
NRST: C29.2 J1.12 U10.7(PG10)
SPI_CLK: U2.19(SCLK) U10.13(PA5)
SPI_MISO: U2.20(DOUT) U10.14(PA6)
SPI_MOSI: U2.21(DIN) U10.15(PA7)
STLINK_RX: J1.13 U10.22(PB10)
STLINK_TX: J1.14 U10.25(PB11)
SWCLK: J1.06 U10.38(PA14-SWCLK) ; port SWCLK
SWDIO: J1.04 U10.37(PA13-SWDIO) ; port SWDIO
SWO: J1.08 U10.40(PB3)
NetR6_2: R6.2 U10.45(PB8-BOOT0)

Not connected (* = marked no-connect by the designer): J1 01* 02* 09* 10*; U2 9(NC) 10(NC) 11(NC) 12(NC) 13(AGND) 14(REFIN) 15(AVDD) 16(SYNC/RESET) 18(DRDY) 22(XTAL2) 23(XTAL1/CLKIN) 24(CAP) 25(DGND) 26(DVDD) 27(NC) 28(AGND); U10 2(PC13)* 3(PC14)* 4(PC15)* 5(PF0) 6(PF1)* 8(PA0)* 9(PA1)* 10(PA2)* 11(PA3)* 12(PA4)* 17(PB1) 18(PB2)* 26(PB12)* 27(PB13)* 28(PB14)* 29(PB15)* 39(PA15)* 41(PB4)* 46(PB9)*

### Notes on the sheet
- MCU
- MCU POWER FILTERING
- (near U10) CURR_12V_BUCK_FANS
- Current Sensing
- CAN
- (near U2) ADC
- Flashing
- (in symbol ADS131M06IRSNR) 1 of 2

### Library data of the parts
C21-C23 = CAP-0.1U-0003: 0.1 µF ±10% 16V Ceramic Capacitor X7R 0603 (1608 Metric)
C24 = CAP-4.7U-0001: CAP CER 4.7UF 25V X5R 0603; Device Class: Ceramic; Size: 0603
C25 C27 = CAP-10N-0002: CAP CER 10000PF 50V X7R 0603; ComponentLink2Description: Datasheet; ComponentLink2URL: http://www.yageo.com/documents/recent/UPY-GPHC_X7R_6.3V-to-50V_18.pdf; Device Class: Ceramic; Size: 0603
C26 C28 = CAP-1U-0002: CAP CER 1UF 16V X7R 0603; Device Class: Ceramic; Size: 0603
C29 = CAP-100N-0001: CAP CER 0.1UF 100V X7R 0603; Device Class: Ceramic; Size: 0603; ComponentLink1Description: Datasheet; ComponentLink1URL: https://www.yageo.com/upload/media/product/app/datasheet/mlcc/upy-np0x7r_mv_100-to-630v.pdf
J1 = CONN_Flashing-0001: Connector Header Surface Mount 14 position 0.050" (1.27mm); MF: Samtec; Value: *; Price: None; Package: None; Availability: Unavailable; MP: FTSH-107-01-L-DV-K; ComponentLink1Description: Datasheet; ComponentLink1URL: https://mm.digikey.com/Volume0/opasdata/d220001/medias/docus/6209/ftsh-1xx-xx-xxx-dv-xxx-xxx-x-xx-mkt.pdf
R6 = RES-0-0001: as R7 on sheet Daughter_Card_Connectors; Size: 0603; ComponentLink1Description: Datasheet; ComponentLink1URL: https://www.yageo.com/upload/media/product/products/datasheet/rchip/PYu-RC_Group_51_RoHS_L_12.pdf
R23-R25 = RES-10k-0002: RES SMD 10kO 5% 1/10W 0603; Manufacturer_Name: Yageo; Copyright: Copyright (C) 2025 Ultra Librarian. All rights reserved.; Manufacturer_Part_Number: RC0603JR-0710KL
U2 = ADS131M06IRSNR: Six-channel, 24-bit, 32-kSPS, simultaneous-sampling, delta-sigma ADC 32-QFN -40 to 125; Manufacturer_Name: Texas Instruments; Copyright: Copyright (C) 2026 Ultra Librarian. All rights reserved.; Manufacturer_Part_Number: ADS131M06IRSNR; RefDes: RefDes; Type: Type
U10 = IC-STM32G431CBT6: IC MCU 32BIT 128KB FLASH 48LQFP; Package: 48LQFP; ComponentLink1Description: Datasheet; ComponentLink1URL: https://www.st.com/resource/en/datasheet/stm32g431cb.pdf

## Sheet PGOODs.SchDoc
size A; SheetNumber: 4; SheetTotal: 7
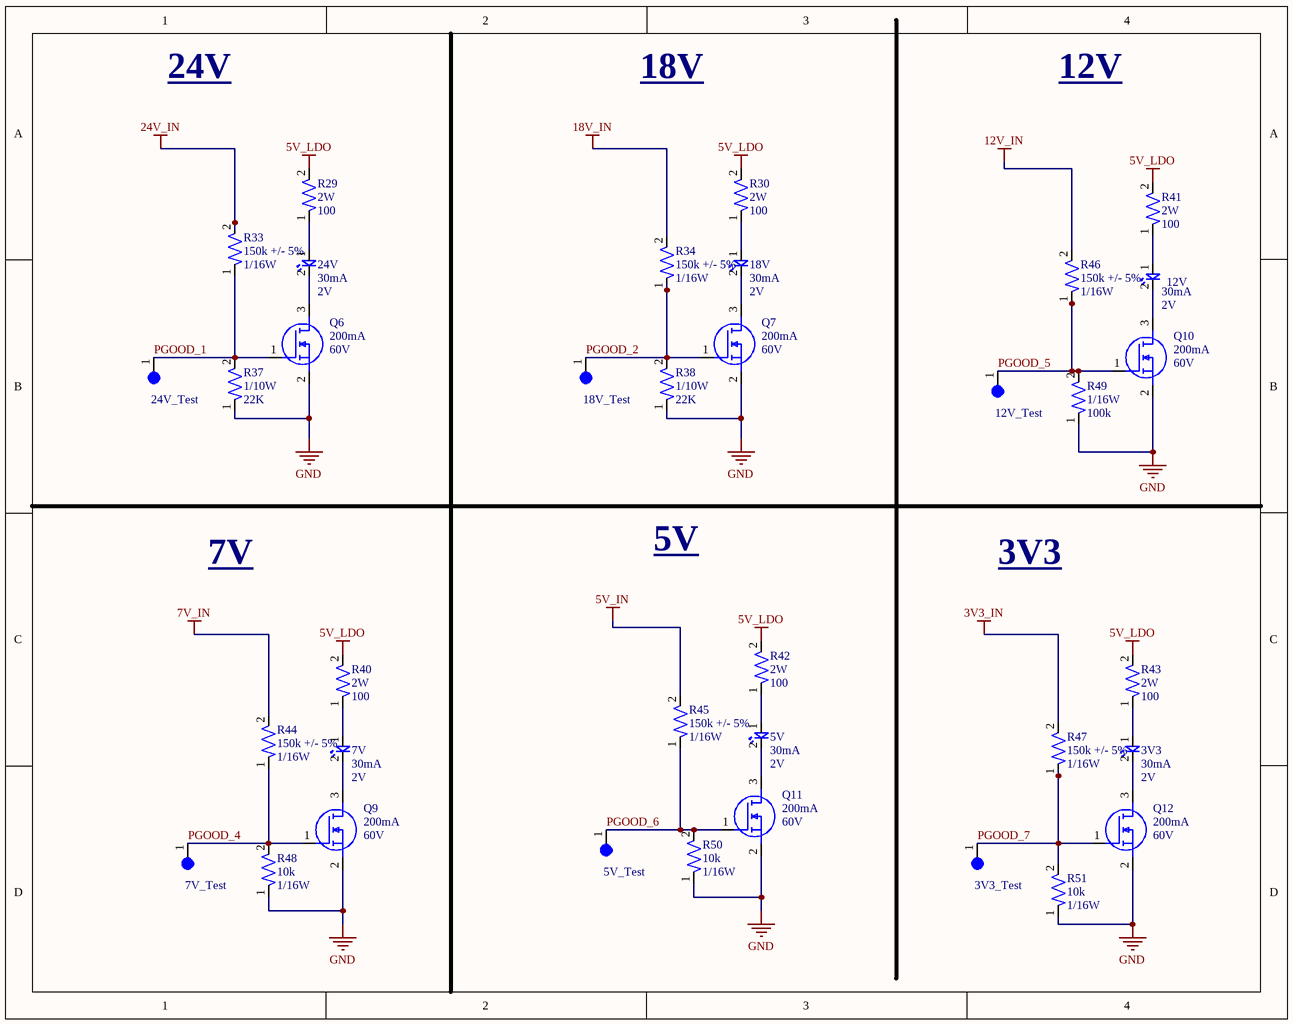
[diagram p6: PGOODs.SchDoc]

### Parts
3V3  Forward Current: 30mA  Forward Voltage: 2V  [LED-0603]  (hidden comment: BL-HKC36G-AV-TRB)
3V3_Test  5003  [TEST-POINT-0001]  (value not drawn)
5V  Forward Current: 30mA  Forward Voltage: 2V  [LED-0603]  (hidden comment: BL-HKC36G-AV-TRB)
5V_Test  5003  [TEST-POINT-0001]  (value not drawn)
7V  Forward Current: 30mA  Forward Voltage: 2V  [LED-0603]  (hidden comment: BL-HKC36G-AV-TRB)
7V_Test  5003  [TEST-POINT-0001]  (value not drawn)
12V  Forward Current: 30mA  Forward Voltage: 2V  [LED-0603]  (hidden comment: BL-HKC36G-AV-TRB)
12V_Test  5003  [TEST-POINT-0001]  (value not drawn)
18V  Forward Current: 30mA  Forward Voltage: 2V  [LED-0603]  (hidden comment: BL-HKC36G-AV-TRB)
18V_Test  5003  [TEST-POINT-0001]  (value not drawn)
24V  Forward Current: 30mA  Forward Voltage: 2V  [LED-0603]  (hidden comment: BL-HKC36G-AV-TRB)
24V_Test  5003  [TEST-POINT-0001]  (value not drawn)
Q6  Continuous Current: 200mA  Voltage: 60V  [IC-SOT23-3]  (hidden comment: T2N7002AK,LM)
Q7  Continuous Current: 200mA  Voltage: 60V  [IC-SOT23-3]  (hidden comment: T2N7002AK,LM)
Q9  Continuous Current: 200mA  Voltage: 60V  [IC-SOT23-3]  (hidden comment: T2N7002AK,LM)
Q10  Continuous Current: 200mA  Voltage: 60V  [IC-SOT23-3]  (hidden comment: T2N7002AK,LM)
Q11  Continuous Current: 200mA  Voltage: 60V  [IC-SOT23-3]  (hidden comment: T2N7002AK,LM)
Q12  Continuous Current: 200mA  Voltage: 60V  [IC-SOT23-3]  (hidden comment: T2N7002AK,LM)
R29  Power: 2W  Resistance: 100  [RES-2512]  (hidden comment: SR2512JK-7W100RL)
R30  Power: 2W  Resistance: 100  [RES-2512]  (hidden comment: SR2512JK-7W100RL)
R33  Resistance: 150k +/- 5%  Power: 1/16W  [RES-0603]  (hidden comment: *RC0402JR-07150KL)
R34  Resistance: 150k +/- 5%  Power: 1/16W  [RES-0603]  (hidden comment: *RC0402JR-07150KL)
R37  Power: 1/10W  Resistance: 22K  [RES-0603]  (hidden comment: RC0603FR-0722KL)
R38  Power: 1/10W  Resistance: 22K  [RES-0603]  (hidden comment: RC0603FR-0722KL)
R40  Power: 2W  Resistance: 100  [RES-2512]  (hidden comment: SR2512JK-7W100RL)
R41  Power: 2W  Resistance: 100  [RES-2512]  (hidden comment: SR2512JK-7W100RL)
R42  Power: 2W  Resistance: 100  [RES-2512]  (hidden comment: SR2512JK-7W100RL)
R43  Power: 2W  Resistance: 100  [RES-2512]  (hidden comment: SR2512JK-7W100RL)
R44  Resistance: 150k +/- 5%  Power: 1/16W  [RES-0603]  (hidden comment: *RC0402JR-07150KL)
R45  Resistance: 150k +/- 5%  Power: 1/16W  [RES-0603]  (hidden comment: *RC0402JR-07150KL)
R46  Resistance: 150k +/- 5%  Power: 1/16W  [RES-0603]  (hidden comment: *RC0402JR-07150KL)
R47  Resistance: 150k +/- 5%  Power: 1/16W  [RES-0603]  (hidden comment: *RC0402JR-07150KL)
R48  Resistance: 10k  Power: 1/16W  [RES-0603]  (hidden comment: RC0402FR-0710KL)
R49  Power: 1/16W  Resistance: 100k  [RES-0603]  (hidden comment: RC0402FR-07100KL)
R50  Resistance: 10k  Power: 1/16W  [RES-0603]  (hidden comment: RC0402FR-0710KL)
R51  Resistance: 10k  Power: 1/16W  [RES-0603]  (hidden comment: RC0402FR-0710KL)

### Nets
3V3_IN: R47.2
5V_IN: R45.2
5V_LDO: R29.2 R30.2 R40.2 R41.2 R42.2 R43.2
7V_IN: R44.2
12V_IN: R46.2
18V_IN: R34.2
24V_IN: R33.2
GND: Q6.2(S) Q7.2(S) Q9.2(S) Q10.2(S) Q11.2(S) Q12.2(S) R37.1 R38.1 R48.1 R49.1 R50.1 R51.1  [project net AGND]
PGOOD_1: 24V_Test.1 Q6.1(G) R33.1 R37.2
PGOOD_2: 18V_Test.1 Q7.1(G) R34.1 R38.2
PGOOD_4: 7V_Test.1 Q9.1(G) R44.1 R48.2
PGOOD_5: 12V_Test.1 Q10.1(G) R46.1 R49.2
PGOOD_6: 5V_Test.1 Q11.1(G) R45.1 R50.2
PGOOD_7: 3V3_Test.1 Q12.1(G) R47.1 R51.2
Net3V3_1: 3V3.1 R43.1
Net3V3_2: 3V3.2 Q12.3(D)
Net5V_1: 5V.1 R42.1
Net5V_2: 5V.2 Q11.3(D)
Net7V_1: 7V.1 R40.1
Net7V_2: 7V.2 Q9.3(D)
Net12V_1: 12V.1 R41.1
Net12V_2: 12V.2 Q10.3(D)
Net18V_1: 18V.1 R30.1
Net18V_2: 18V.2 Q7.3(D)
Net24V_1: 24V.1 R29.1
Net24V_2: 24V.2 Q6.3(D)

### Notes on the sheet
- 24V
- 18V
- 12V
- 7V
- 5V
- 3V3

### Library data of the parts
3V3 5V 7V 12V 18V 24V = LED-0001: LED YELLOW CLEAR 0603 SMD; ComponentLink1Description: Datasheet; ComponentLink1URL: https://www.americanbrightled.com/pdffiles/led-components/smt/BL-HKC36G-AV-TRB.pdf
3V3_Test 5V_Test 7V_Test 12V_Test 18V_Test 24V_Test = TEST-POINT-0001: as GND on sheet Other_Connectors
Q6 Q7 Q9-Q12 = NMOS-200MA-0001: MOSFET N-CH 60V 200MA SOT23; ComponentLink1Description: Datasheet; ComponentLink1URL: https://toshiba.semicon-storage.com/info/T2N7002AK_datasheet_en_20150401.pdf?did=29712&prodName=T2N7002AK
R29 R30 R40-R43 = RES-100-0002: 100 Ohms ±5% 2W Chip Resistor 2512 (6332 Metric) Automotive AEC-Q200, Pulse Withstanding Thick Film
R33 R34 R44-R47 = RES-150K-0001: 150 kOhms ±5% 0.063W, 1/16W Chip Resistor 0603 (1005 Metric) Moisture Resistant Thick Film
R37 R38 = RES-22k-0001: 22 kOhms ±1% 0.1W, 1/10W Chip Resistor 0603 (1608 Metric) Moisture Resistant Thick Film; Parameter 1: *
R48 R50 R51 = RES-10k-0001: RES 10K OHM 1% 1/16W 0402; Tolerance: 1%; Size: 0402; ComponentLink1Description: Datasheet; ComponentLink1URL: https://www.yageo.com/upload/media/product/products/datasheet/rchip/PYu-RC_Group_51_RoHS_L_12.pdf
R49 = RES-100k-0002: 100 kOhms ±1% 0.063W, 1/16W Chip Resistor 0402 (1005 Metric) Moisture Resistant Thick Film

## Nets that join several sheets
3V3_IN: Daughter_Card_Connectors (J22.01), Other_Connectors (D17.1 J7.1 J7.2), PGOODs (R47.2)
5V_IN: Daughter_Card_Connectors (J15.01), Other_Connectors (8 pins), PGOODs (R45.2)
5V_LDO: LDOs (10 pins), CAN_Transciever (U1.3), PGOODs (6 pins)
7V_IN: Daughter_Card_Connectors (J25.01), Other_Connectors (D15.1), LDOs (C15.2 I2.3), PGOODs (R44.2)
12V_IN: Daughter_Card_Connectors (J24.01), Other_Connectors (7 pins), PGOODs (R46.2)
18V_IN: Daughter_Card_Connectors (J14.01), Other_Connectors (D12.1 J8.1 J8.2), PGOODs (R34.2)
24V_IN: Daughter_Card_Connectors (J17.01), Other_Connectors (D13.1 J9.1 J9.2), PGOODs (R33.2)
AGND: Daughter_Card_Connectors (18 pins), Other_Connectors (33 pins), LDOs (14 pins), CAN_Transciever (Q1.2 Q2.2 U1.2), MCU (27 pins), PGOODs (12 pins)
VBAT: Daughter_Card_Connectors (J19.01 J21.01 J27.01), Other_Connectors (5 pins)
VBAT_MCU: LDOs (8 pins), CAN_Transciever (R4.2 R5.2 U1.5), MCU (15 pins)
AUTON_LED_B: Other_Connectors (J3.6), MCU (R25.1 U10.42)
AUTON_LED_G: Other_Connectors (J3.5), MCU (R24.1 U10.43)
AUTON_LED_R: Other_Connectors (J3.4), MCU (R23.1 U10.44)
CAN_N: Other_Connectors (J2.2 J5.2), CAN_Transciever (R3.1 U1.6)
CAN_P: Other_Connectors (J2.1 J5.1), CAN_Transciever (R3.2 U1.7)
CAN_RX_LED: CAN_Transciever (R2.2), MCU (U10.30)
CAN_STB: CAN_Transciever (U1.8), MCU (U10.32)
CAN_TX_LED: CAN_Transciever (R1.2), MCU (U10.31)
CURR_3V3_BUCK: Daughter_Card_Connectors (C6.2 R11.1), MCU (U2.8)
CURR_5V_BUCK: Daughter_Card_Connectors (C3.2 R8.1), MCU (U2.1)
CURR_7V_BUCK: Daughter_Card_Connectors (C4.2 R10.1), MCU (U2.5)
CURR_12V_BUCK: Daughter_Card_Connectors (C5.2 R12.1), MCU (U2.4)
CURR_18V_BUCK: Daughter_Card_Connectors (C2.2 R9.1), MCU (U2.32)
CURR_24V_BUCK: Daughter_Card_Connectors (C1.2 R7.1), MCU (U2.29)
FDCAN_RX: CAN_Transciever (U1.4), MCU (U10.33)
FDCAN_TX: CAN_Transciever (U1.1), MCU (U10.34)